# Altium project MPPT_PCB_Project.PrjPcb
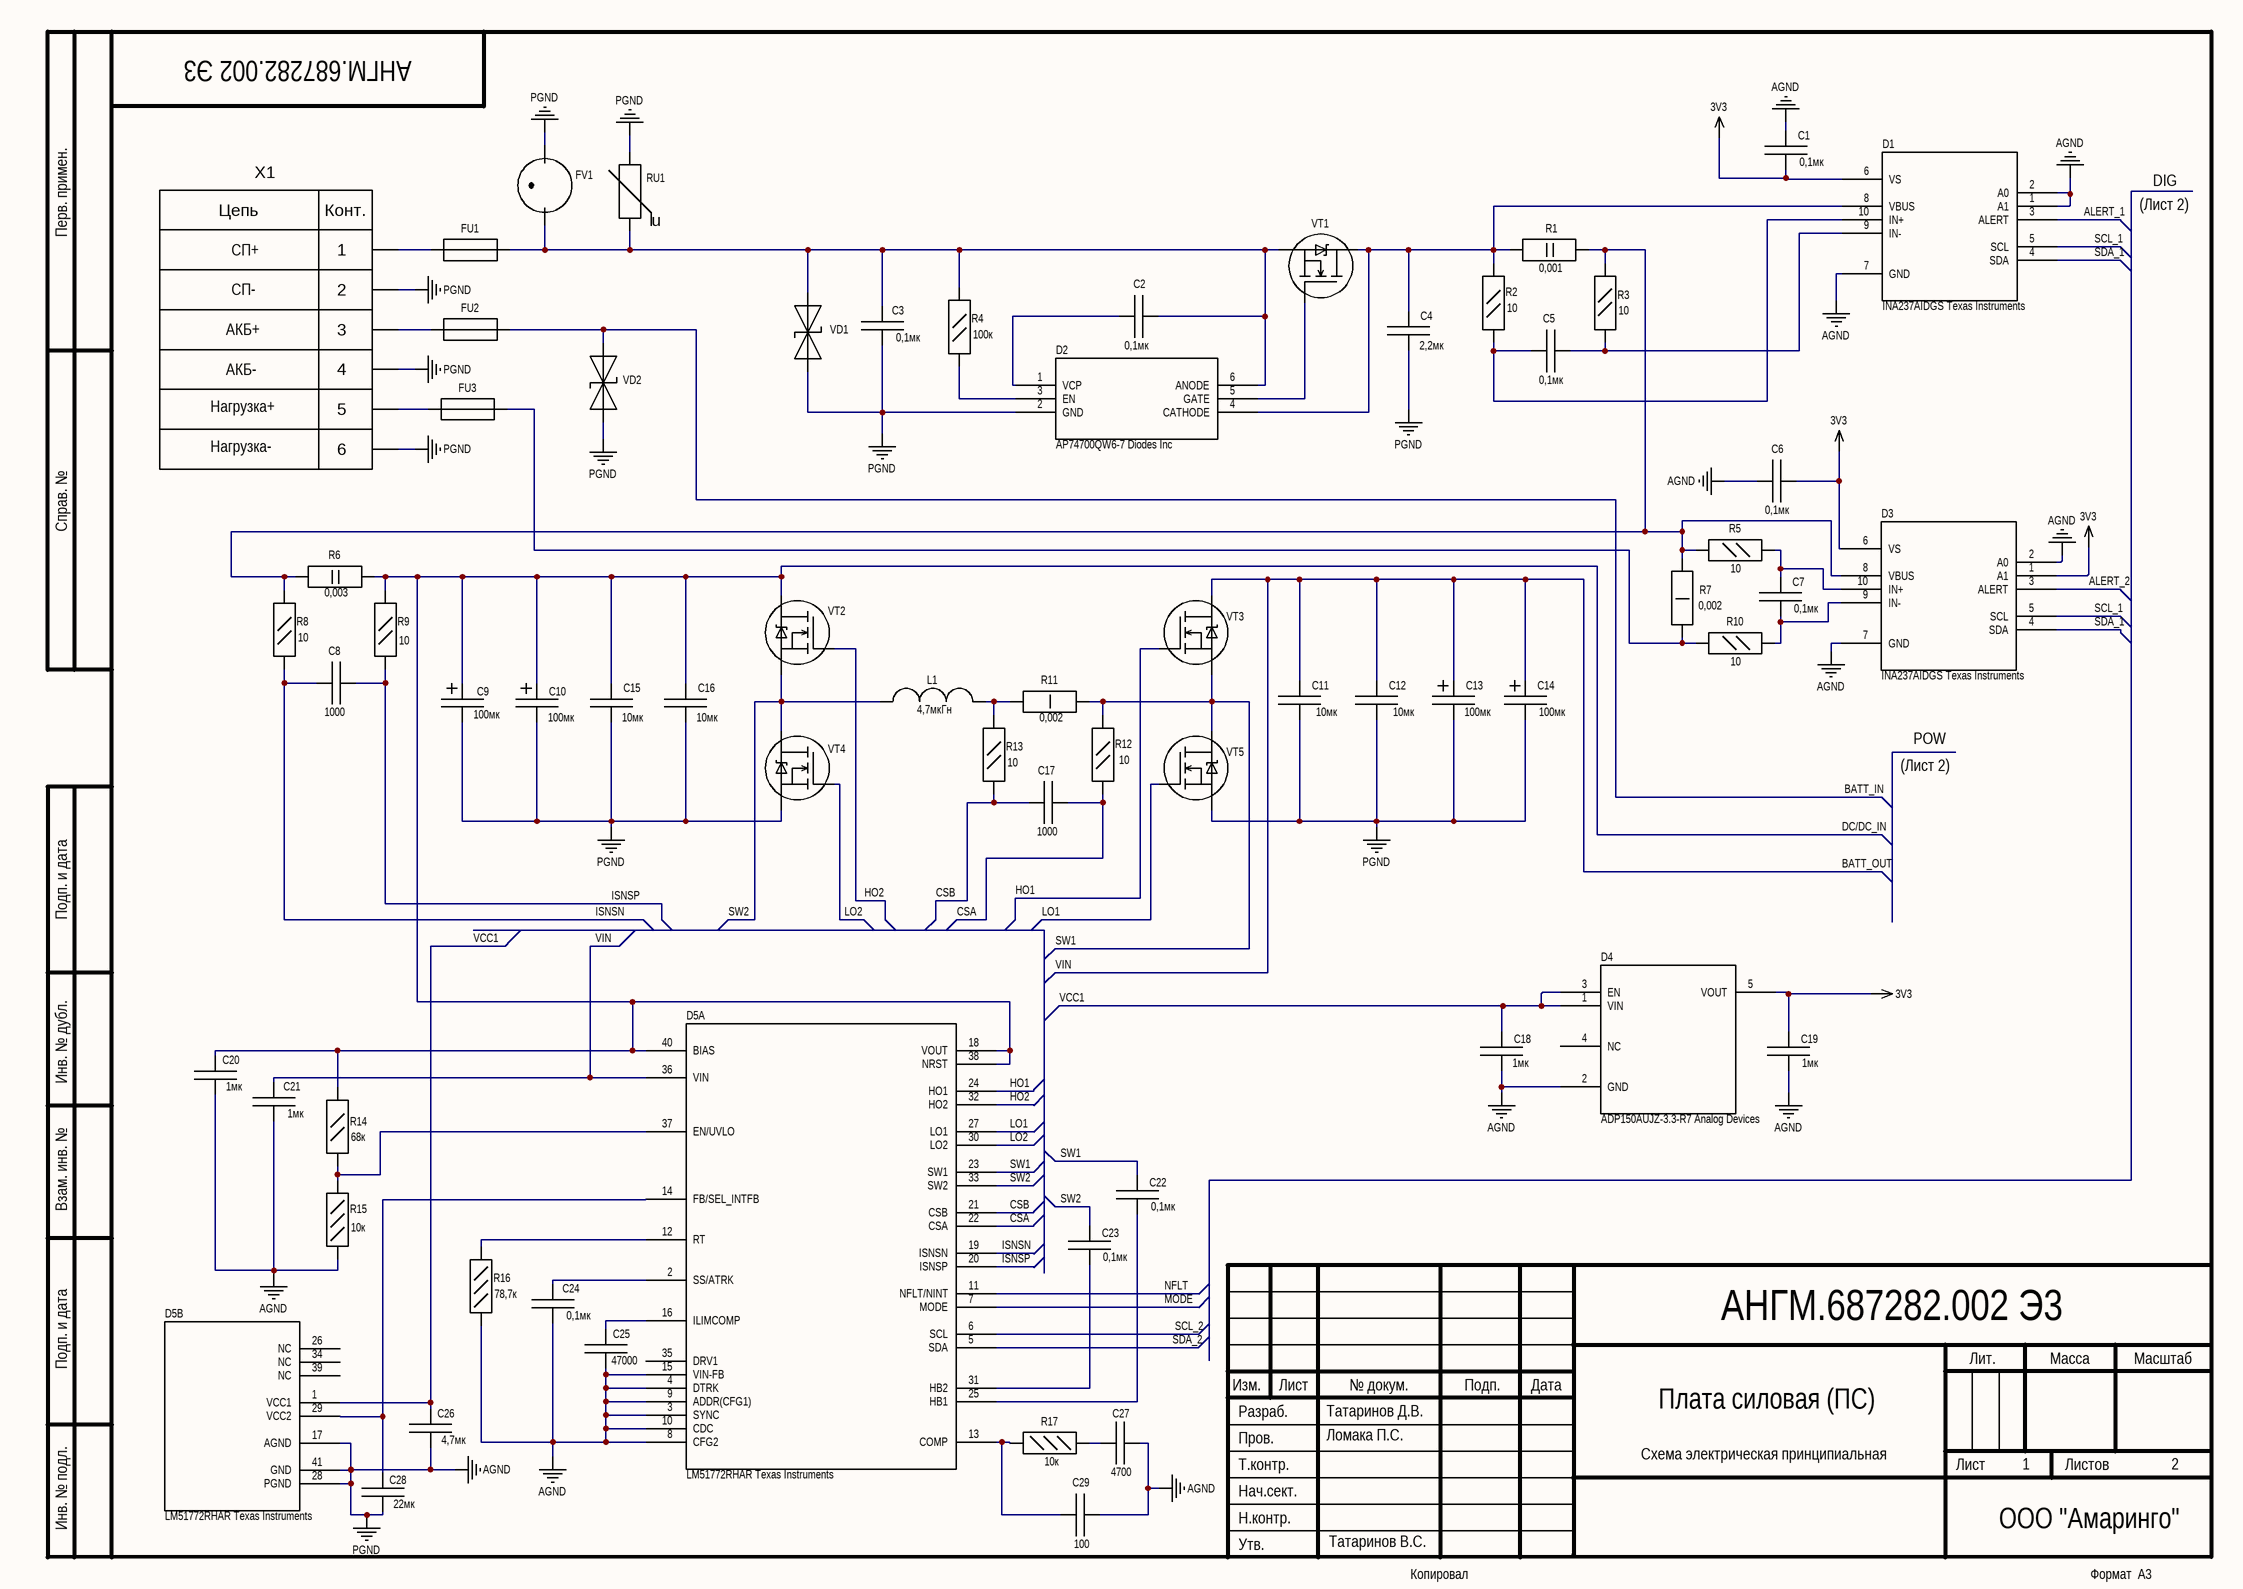
[diagram p0: Лист 1.SchDoc]
DecimalNumber: АНГМ.436437.002; Децимальный номер печатного узла: АНГМ.436437.002; Код типа схемы: Э3; Компания: ООО "Амаринго"; Литера: О1; Наименование: Печатная плата ПС; Наименование1: Печатная плата ПС; Наименование_PCB: Плата печатная ПС; Обозначение: АНГМ.758725.002 СБ; Обозначение_PCB: АНГМ.758725.002 СБ; Обозначение_Код: АНГМ.758725.002 СБ; Папка для сохранения графической документации: Документация; Папка для сохранения текстовой документации: Документация; Проверил: Ломака П.С.; Разработал: Татаринов Д.В.; Тип документа: Схема электрическая принципиальная; Утвердил: Татаринов В.С.; п_Пров_Р: Ломака; п_Разраб_Р: Татаринов; п_Утв_Р: Татаринов
2 sheets, 111 parts. Net scope: global (net labels, ports and power ports of the same name join across sheets).
Board file: MPPT_Power_Board.PcbDoc
Sheets:
  Лист 1.SchDoc
  Лист 2.SchDoc

## Sheet Лист 1.SchDoc
size 420 x 297 mm; ListNumber: 1; ApprovedBy: Татаринов В.С.; CheckedBy: Ломака П.С.; Author: Татаринов Д.В.; CompanyName: ООО "Амаринго"; SheetNumber: 1; SheetTotal: 2; PageSetup: Record=PageOptions|CenterHorizontal=True|CenterVertical=True|PrintScale=0.94|XCorrection=1.00|YCorrection=1.00|PrintKind=1|BorderSize=5000000|LeftOffset=0|BottomOffset=0|Orientation=1|PaperLength=1000|PaperWidth=1000|Scale=100|PaperSource=7|PrintQuality=-4|MediaType=1|DitherType=10|PaperKind=A4|PrintScaleMode=1; DecimalNumber: АНГМ.687282.002 Э3; Name: Силовая плата контроллера заряда MPPT; DocumentName: Sheet1.SCHDOC

### Parts
C1  Capacitance: 0,1мк  [CC0603]  (hidden comment: CL10B104KO8NNNC Samsung Electronics)
C2  Capacitance: 0,1мк  [CC0805]  (hidden comment: CC0805KKX7R0BB104 Yageo)
C3  Capacitance: 0,1мк  [CC0805]  (hidden comment: CC0805KKX7R0BB104 Yageo)
C4  Capacitance: 2,2мк  [CC1206]  (hidden comment: CC1206KKX7R0BB225 Yageo)
C5  Capacitance: 0,1мк  [CC0805]  (hidden comment: CC0805KKX7R0BB104 Yageo)
C6  Capacitance: 0,1мк  [CC0603]  (hidden comment: CL10B104KO8NNNC Samsung Electronics)
C7  Capacitance: 0,1мк  [CC0805]  (hidden comment: CC0805KKX7R0BB104 Yageo)
C8  Capacitance: 1000  [CC0603]  (hidden comment: GRM1885C1H102JA01D Murata Electronics)
C9  Capacitance: 100мк  [EEUFC2A101]  (hidden comment: 100ZLH100MEFC10x20 Rubycon)
C10  Capacitance: 100мк  [EEUFC2A101]  (hidden comment: 100ZLH100MEFC10x20 Rubycon)
C11  Capacitance: 10мк  [CC2220]  (hidden comment: 2220B106K101N05 Hitano)
C12  Capacitance: 10мк  [CC2220]  (hidden comment: 2220B106K101N05 Hitano)
C13  Capacitance: 100мк  [EEUFC2A101]  (hidden comment: 100ZLH100MEFC10x20 Rubycon)
C14  Capacitance: 100мк  [EEUFC2A101]  (hidden comment: 100ZLH100MEFC10x20 Rubycon)
C15  Capacitance: 10мк  [CC2220]  (hidden comment: 2220B106K101N05 Hitano)
C16  Capacitance: 10мк  [CC2220]  (hidden comment: 2220B106K101N05 Hitano)
C17  Capacitance: 1000  [CC0603]  (hidden comment: GRM1885C1H102JA01D Murata Electronics)
C18  Capacitence: 1мк  [CC0603]  (hidden comment: GCM188R71E105KA64D Murata Electronics)
C19  Capacitence: 1мк  [CC0603]  (hidden comment: GCM188R71E105KA64D Murata Electronics)
C20  Capacitance: 1мк  [CC0603]  (hidden comment: CC0603KRX7R9BB105 Yageo)
C21  Capacitance: 1мк  [CC0603]  (hidden comment: CC0603KRX7R9BB105 Yageo)
C22  Capacitance: 0,1мк  [CC0805]  (hidden comment: CC0805KKX7R0BB104 Yageo)
C23  Capacitance: 0,1мк  [CC0805]  (hidden comment: CC0805KKX7R0BB104 Yageo)
C24  Capacitance: 0,1мк  [CC0603]  (hidden comment: CL10B104KO8NNNC Samsung Electronics)
C25  Capacitance: 47000  [CC0603]  (hidden comment: CL10B473KB8NNNC Samsung Electronics)
C26  Capacitance: 4,7мк  [CC0805]  (hidden comment: CC0805KKX7R7BB475 Yageo)
C27  Capacitance: 4700  [CC0603]  (hidden comment: CC0603JRX7R9BB472 Yageo)
C28  Capacitance: 22мк  [CC1206]  (hidden comment: GRM31CR61C226KE15L Murata Electronics)
C29  Capacitance: 100  [CC0603]  (hidden comment: CC0603JRNPO9BN101 Yageo)
D1  INA237AIDGS Texas Instruments  [VSSOP]
D2  AP74700QW6-7 Diodes Inc  [SOT26]
D3  INA237AIDGS Texas Instruments  [VSSOP]
D4  ADP150AUJZ-3.3-R7 Analog Devices  [TSOT (UJ-5)]
D5  LM51772RHAR Texas Instruments  [LM51772]  (parts A,B of 2)
FU1  FT40A.50 Tesla  [3522-2_KEY]  (value not drawn)
FU2  0287020L Littelfuse  [3522-2_KEY]  (value not drawn)
FU3  0287020L Littelfuse  [3522-2_KEY]  (value not drawn)
FV1  B88069X1380S102 EPCOS  [B88069X1380S102 EPCOS]  (value not drawn)
L1  Inductance: 4,7мкГн  [SRP1770TA]  (hidden comment: SRP1770TA-4R7M Bourns)
R1  Resistance: 0,001  [RC2512]  (hidden comment: PMR100HZPFV1L00 Pohm)
R2  Resistance: 10  [RC0805]  (hidden comment: RC0805JR-0710RL Yageo)
R3  Resistance: 10  [RC0805]  (hidden comment: RC0805JR-0710RL Yageo)
R4  Resistance: 100к  [RC0805]  (hidden comment: RC0805JR-07100KL Yageo)
R5  Resistance: 10  [RC0805]  (hidden comment: RC0805JR-0710RL Yageo)
R6  Resistance: 0,003  [RC2512]  (hidden comment: FMF25FPJR003-BH Prosperity Dielectrics)
R7  Resistance: 0,002  [RC2512]  (hidden comment: RLM25FECR002 TA-I)
R8  Resistance: 10  [RC0805]  (hidden comment: RC0805JR-0710RL Yageo)
R9  Resistance: 10  [RC0805]  (hidden comment: RC0805JR-0710RL Yageo)
R10  Resistance: 10  [RC0805]  (hidden comment: RC0805JR-0710RL Yageo)
R11  Resistance: 0,002  [RC2512]  (hidden comment: RLM25FECR002 TA-I)
R12  Resistance: 10  [RC0805]  (hidden comment: RC0805JR-0710RL Yageo)
R13  Resistance: 10  [RC0805]  (hidden comment: RC0805JR-0710RL Yageo)
R14  Resistance: 68к  [RC0805]  (hidden comment: RC0805FR-0768KL Yageo)
R15  Resistance: 10к  [RC0603]  (hidden comment: RT0603BRD0710KL Yageo)
R16  Resistance: 78,7к  [RC0603]  (hidden comment: RC0603FR-0778K7L Yageo)
R17  Resistance: 10к  [RC0603]  (hidden comment: RT0603BRD0710KL Yageo)
RU1  Варистор 14D680K Yageo  [14D680K]  (value not drawn)
VD1  SMCJ51CA Littelfuse  [DO-214AB]  (value not drawn)
VD2  SMCJ30CA Hottech  [DO-214AB]  (value not drawn)
VT1  IRFS7730TRL7PP Infineon Technologies  [D2PAK-7PIN]  (value not drawn)
VT2  NTMFS5C628NLT1G ON Semiconductor  [DFN5 (SO-8FL)]  (value not drawn)
VT3  NTMFS5C628NLT1G ON Semiconductor  [DFN5 (SO-8FL)]  (value not drawn)
VT4  NTMFS5C628NLT1G ON Semiconductor  [DFN5 (SO-8FL)]  (value not drawn)
VT5  NTMFS5C628NLT1G ON Semiconductor  [DFN5 (SO-8FL)]  (value not drawn)
X1  DG78H-A-06P-13-00A(H) Degson Electronics  [DG78H-A-06P-13-00A(H)]  (value not drawn)

### Nets
3V3: C1.2 C6.2 C19.2 D1.6(VS) D3.1(A1) D3.6(VS) D4.5(VOUT)
AGND: C1.1 C3.1 C4.2 C6.1 C9.1 C10.1 C11.1 C12.1 C13.1 C14.1 C15.2 C16.2 C18.1 C19.1 C20.1 C21.1 C24.2 C25.2 C26.2 C27.2 C28.1 C29.2 D1.1(A1) D1.2(A0) D1.7(GND) D2.2(GND) D3.2(A0) D3.7(GND) D4.2(GND) D5.3(SYNC) D5.4(DTRK) D5.8(CFG2) D5.9(ADDR(CFG1)) D5.10(CDC) D5.15(VIN-FB) D5.17(AGND) D5.28(PGND) D5.41(GND) FV1.2 R15.2 R16.2 RU1.2 VD1.1 VD2.2 VT4.3(s) VT5.3(s) X1.2 X1.4 X1.6  [also labelled PGND]
ALERT_1: D1.3(ALERT)
ALERT_2: D3.3(ALERT)
BATT_IN: FU2.2 VD2.1
BATT_OUT: C11.2 C12.2 C13.2 C14.2 C21.2 D5.36(VIN) VT3.2(d)  [also labelled VIN]
CSA: C17.2 D5.22(CSA) R12.2
CSB: C17.1 D5.21(CSB) R13.2
DC/DC_IN: C9.2 C10.2 C15.1 C16.1 C20.2 D5.18(VOUT) D5.38(NRST) D5.40(BIAS) R6.2 R9.1 R14.1 VT2.2(d)
HO1: D5.24(HO1) VT3.1(g)
HO2: D5.32(HO2) VT2.1(g)
ISNSN: C8.1 D5.19(ISNSN) R8.2
ISNSP: C8.2 D5.20(ISNSP) R9.2
LO1: D5.27(LO1) VT5.1(g)
LO2: D5.30(LO2) VT4.1(g)
MODE: D5.7(MODE)
NFLT: D5.11(NFLT/NINT)
SCL_1: D1.5(SCL) D3.5(SCL)
SCL_2: D5.6(SCL)
SDA_1: D1.4(SDA) D3.4(SDA)
SDA_2: D5.5(SDA)
SW1: C22.2 D5.23(SW1) R11.2 R12.1 VT3.3(s) VT5.2(d)
SW2: C23.2 D5.33(SW2) L1.1 VT2.3(s) VT4.2(d)
VCC1: C18.2 C26.1 D4.1(VIN) D4.3(EN) D5.1(VCC1)
NetC2_1: C2.1 D2.1(VCP)
NetC2_2: C2.2 C3.2 D2.6(ANODE) FU1.2 FV1.1 R4.1 RU1.1 VD1.2 VT1.3(s)
NetC4_1: C4.1 D1.8(VBUS) D2.4(CATHODE) R1.1 R2.1 VT1.2(d)
NetC5_1: C5.1 D1.10(IN+) R2.2
NetC5_2: C5.2 D1.9(IN-) R3.1
NetC7_1: C7.1 D3.10(IN+) R5.2
NetC7_2: C7.2 D3.9(IN-) R10.2
NetC22_1: C22.1 D5.25(HB1)
NetC23_1: C23.1 D5.31(HB2)
NetC24_1: C24.1 D5.2(SS/ATRK)
NetC25_1: C25.1 D5.16(ILIMCOMP)
NetC27_1: C27.1 R17.2
NetC28_2: C28.2 D5.14(FB/SEL_INTFB) D5.29(VCC2)
NetC29_1: C29.1 D5.13(COMP) R17.1
NetD2_3: D2.3(EN) R4.2
NetD2_5: D2.5(GATE) VT1.1(g)
NetD3_8: D3.8(VBUS) R1.2 R3.2 R5.1 R6.1 R7.1 R8.1
NetD5_12: D5.12(RT) R16.1
NetD5_37: D5.37(EN/UVLO) R14.2 R15.1
NetFU1_1: FU1.1 X1.1
NetFU2_1: FU2.1 X1.3
NetFU3_1: FU3.1 X1.5
NetFU3_2: FU3.2 R7.2 R10.1
NetL1_2: L1.2 R11.1 R13.1

Not connected (* = marked no-connect by the designer): D4 4(NC); D5 26(NC) 34(NC) 35(DRV1) 39(NC)

### Notes on the sheet
- DIG
- СП+
- (Лист 2)
- СП-
- АКБ+
- АКБ-
- Нагрузка+
- Нагрузка-
- POW
- 2
- Перв. примен.
- Справ. №
- Подп. и дата
- Инв. № дубл.
- Взам. инв. №
- Разраб.
- Изм.
- Лист
- № докум.
- Подп.
- Дата
- Лит.
- Масса
- Масштаб
- Т.контр.
- Пров.
- Плата силовая (ПС)
- Схема электрическая принципиальная
- Листов
- Инв. № подл.
- Утв.
- Н.контр.
- Нач.сект.
- Копировал
- Формат  A3
- (in symbol R_U) u
- (in symbol X_6) Цепь; Конт.

### Library data of the parts
C1 C4 C6-C8 C11 C12 C15 C16 C24 C27 = C: ComponentKind: Конденсатор
  C1 C6 C24: Наименование: CL10B104KO8NNNC Samsung Electronics; Manufacturer: Samsung Electronics; PartNumber: CL10B104KO8NNNC
  C4: Наименование: CC1206KKX7R0BB225 Yageo; Manufacturer: Yageo; PartNumber: CC1206KKX7R0BB225
  C7: Наименование: CC0805KKX7R0BB104 Yageo; Manufacturer: Yageo; PartNumber: CC0805KKX7R0BB104
  C8: Наименование: GRM1885C1H102JA01D Murata Electronics; Manufacturer: Murata Electronics; PartNumber: GRM1885C1H102JA01D
  C11 C12 C15 C16: Наименование: 2220B106K101N05 Hitano; Manufacturer: Hitano; PartNumber: 2220B106K101N05
  C27: Наименование: CC0603JRX7R9BB472 Yageo; Manufacturer: Yageo; PartNumber: CC0603JRX7R9BB472
C2 = C: Керамический, 50В, X7R; ComponentKind: Конденсатор; Наименование: CC0805KKX7R0BB104 Yageo; Manufacturer: Yageo; PartNumber: CC0805KKX7R0BB104
C3 = C: Керамический, 100В, X7R; ComponentKind: Конденсатор; Наименование: CC0805KKX7R0BB104 Yageo; Manufacturer: Yageo; PartNumber: CC0805KKX7R0BB104
C5 C17 = C: Керамический; ComponentKind: Конденсатор
  C5: Наименование: CC0805KKX7R0BB104 Yageo; Manufacturer: Yageo; PartNumber: CC0805KKX7R0BB104
  C17: Наименование: GRM1885C1H102JA01D Murata Electronics; Manufacturer: Murata Electronics; PartNumber: GRM1885C1H102JA01D
C9 C10 C13 C14 = C_POL: ComponentKind: Конденсатор; Наименование: 100ZLH100MEFC10x20 Rubycon; Manufacturer: Rubycon; PartNumber: 100ZLH100MEFC10x20
C18 = C: Керами; ComponentKind: Конденсатор; Наименование: GCM188R71E105KA64D Murata Electronics; Manufacturer: Murata Electronics; PartNumber: GCM188R71E105KA64D
C19 = C: Керамический, от 10В; ComponentKind: Конденсатор; Наименование: GCM188R71E105KA64D Murata Electronics; Manufacturer: Murata Electronics; PartNumber: GCM188R71E105KA64D
C20 C21 = C: Керамический, 50В; ComponentKind: Конденсатор; Наименование: CC0603KRX7R9BB105 Yageo; Manufacturer: Yageo; PartNumber: CC0603KRX7R9BB105
C22 C23 = C: Керамика, 50В; ComponentKind: Конденсатор; Наименование: CC0805KKX7R0BB104 Yageo; Manufacturer: Yageo; PartNumber: CC0805KKX7R0BB104
C25 = C: Керамический, X7R или NP0/COG; ComponentKind: Конденсатор; Наименование: CL10B473KB8NNNC Samsung Electronics; Manufacturer: Samsung Electronics; PartNumber: CL10B473KB8NNNC
C26 = C: Керамический, X7R, 10-16В; ComponentKind: Конденсатор; Наименование: CC0805KKX7R7BB475 Yageo; Manufacturer: Yageo; PartNumber: CC0805KKX7R7BB475
C28 = C: Керамический, X7R (X5R), 10-16В; ComponentKind: Конденсатор; Наименование: GRM31CR61C226KE15L Murata Electronics; Manufacturer: Murata Electronics; PartNumber: GRM31CR61C226KE15L
C29 = C: Керамический, NP0 (COG); ComponentKind: Конденсатор; Наименование: CC0603JRNPO9BN101 Yageo; Manufacturer: Yageo; PartNumber: CC0603JRNPO9BN101
D1 D3 = INA237AIDGSR: 85-V, 16-bit, I2C output current/voltage/power monitor with alert 10-VSSOP -40 to 125; Copyright: Copyright (C) 2026 Ultra Librarian. All rights reserved.; Manufacturer_Name: Texas Instruments; Manufacturer_Part_Number: INA237AIDGSR; RefDes: RefDes; Type: Type; ComponentKind: Микросхема; Наименование: INA237AIDGS Texas Instruments; Manufacturer: Texas Instruments; PartNumber: INA237AIDGS
D2 = AP74700QW6-7: Description; Copyright: Copyright (C) 2025 Ultra Librarian. All rights reserved.; Manufacturer_Name: Diodes Inc; Manufacturer_Part_Number: AP74700QW6-7; RefDes: RefDes; Type: Type; ComponentKind: Микросхема; Наименование: AP74700QW6-7 Diodes Inc; Manufacturer: Diodes Inc; PartNumber: AP74700QW6-7
D4 = ADP150AUJZ-3.3-R7: Ultralow Noise, 150 mA CMOS Linear Regulator; Manufacturer_Name: Analog Devices Inc; Copyright: Copyright (C) 2025 Ultra Librarian. All rights reserved.; Manufacturer_Part_Number: ADP150AUJZ-3.3-R7; RefDes: RefDes; Type: Type; ComponentKind: Микросхема; Наименование: ADP150AUJZ-3.3-R7 Analog Devices; Manufacturer: Analog Devices; PartNumber: ADP150AUJZ-3.3-R7
D5 = LM51772RHAR: 55V wide VIN four-switch buck-boost controller with I2C interface 40-VQFN -40 to 125; Copyright: Copyright (C) 2025 Ultra Librarian. All rights reserved.; Manufacturer_Name: Texas Instruments; Manufacturer_Part_Number: LM51772RHAR; RefDes: RefDes; Type: Type; ComponentKind: Микросхема; Наименование: LM51772RHAR Texas Instruments; Manufacturer: Texas Instruments; PartNumber: LM51772RHAR
FU1 = FU: 40А; ComponentKind: Предохранитель; Наименование: FT40A.50 Tesla; Manufacturer: Tesla; PartNumber: FT40A.50
FU2 FU3 = FU: 20А; ComponentKind: Предохранитель; Наименование: 0287020L Littelfuse; Manufacturer: Littelfuse; PartNumber: 0287020L
FV1 = FV: ComponentKind: Разрядник; Наименование: B88069X1380S102 EPCOS; Manufacturer: EPCOS; PartNumber: B88069X1380S102
L1 = L: ComponentKind: Дроссель; Наименование: SRP1770TA-4R7M Bourns; Manufacturer: Bourns; PartNumber: SRP1770TA-4R7M
R1 = R_2W: Корпус 2512 или 2816; Power: 2 Вт; Tolerance: 1%; Value: 1 мОм; ComponentKind: Резистор; Type: RC2512; Наименование: PMR100HZPFV1L00 Pohm; Manufacturer: Pohm; PartNumber: PMR100HZPFV1L00
R2 R3 R8 R9 R12 R13 = R_0,125W: Корпус 0603; Power: 0,125 Вт; Tolerance: 5%; Value: 10 Ом; ComponentKind: Резистор; Type: RC0805; Наименование: RC0805JR-0710RL Yageo; Manufacturer: Yageo; PartNumber: RC0805JR-0710RL
R4 = R_0,125W: Корпус 0603; Power: 0,125 Вт; Tolerance: 5%; Value: 100 кОм; ComponentKind: Резистор; Type: RC0805; Наименование: RC0805JR-07100KL Yageo; Manufacturer: Yageo; PartNumber: RC0805JR-07100KL
R5 R10 = R_0,125W: Power: 0,125 Вт; Tolerance: 5%; Value: 10 Ом; ComponentKind: Резистор; Type: RC0805; Наименование: RC0805JR-0710RL Yageo; Manufacturer: Yageo; PartNumber: RC0805JR-0710RL
R6 = R_2W: Корпус 2512; Power: 2 Вт; Tolerance: 1%; Value: 3 мОм; ComponentKind: Резистор; Type: RC2512; Наименование: FMF25FPJR003-BH Prosperity Dielectrics; Manufacturer: Prosperity Dielectrics; PartNumber: FMF25FPJR003-BH
R7 R11 = R_1W: Корпус 2512; Power: 1 Вт; Tolerance: 1%; Value: 2 мОм; ComponentKind: Резистор; Type: RC2512; Наименование: RLM25FECR002 TA-I; Manufacturer: TA-I; PartNumber: RLM25FECR002
R14 = R_0,125W: Корпус 0603; Power: 0,125 Вт; Tolerance: 1%; Value: 68 кОм; ComponentKind: Резистор; Type: RC0805; Наименование: RC0805FR-0768KL Yageo; Manufacturer: Yageo; PartNumber: RC0805FR-0768KL
R15 R17 = R_0,05W: Корпус 0402; Power: 0,05 Вт; Tolerance: 1%; Value: 10 кОм; ComponentKind: Резистор; Type: RC0201; Наименование: RT0603BRD0710KL Yageo; Manufacturer: Yageo; PartNumber: RT0603BRD0710KL
R16 = R_0,05W: Корпус 0402; Power: 0,05 Вт; Tolerance: 1%; Value: 78,7 кОм; ComponentKind: Резистор; Type: RC0201; Наименование: RC0603FR-0778K7L Yageo; Manufacturer: Yageo; PartNumber: RC0603FR-0778K7L
RU1 = R_U: ComponentKind: Варистор; Наименование: 14D680K Yageo; Manufacturer: Yageo; PartNumber: 14D680K
VD1 = VD_TVS: Наименование: Диод защитный SMCJ51CA Littelfuse; ComponentKind: Диод защитный; Manufacturer: Littelfuse; PartNumber: SMCJ51CA
VD2 = VD_TVS: SMCJ33A; Наименование: Диод защитный SMCJ30CA Hottech; ComponentKind: Диод защитный; Manufacturer: Hottech; PartNumber: SMCJ30CA
VT1 = N_GDS: ComponentKind: Транзистор; Наименование: IRFS7730TRL7PP Infineon Technologies; Manufacturer: Infineon Technologies; PartNumber: IRFS7730TRL7PP
VT2-VT5 = N_GDS: Наименование: Транзистор NTMFS5C628NLT1G ON Semiconductor; ComponentKind: Транзистор; Manufacturer: ON Semiconductor; PartNumber: NTMFS5C628NLT1G
X1 = X_6: ComponentKind: Клеммник; Наименование: DG78H-A-06P-13-00A(H) Degson Electronics; Manufacturer: Degson Electronics; PartNumber: DG78H-A-06P-13-00A(H)

## Sheet Лист 2.SchDoc: Наименование
size 420 x 297 mm; ListNumber: 1; SheetNumber: 2; SheetTotal: 2; PageSetup: Record=PageOptions|CenterHorizontal=True|CenterVertical=True|PrintScale=0.94|XCorrection=1.00|YCorrection=1.00|PrintKind=1|BorderSize=5000000|LeftOffset=0|BottomOffset=0|Orientation=1|PaperLength=1000|PaperWidth=1000|Scale=100|PaperSource=7|PrintQuality=-4|MediaType=1|DitherType=10|PaperKind=A4|PrintScaleMode=1; DecimalNumber: АНГМ.687282.002 Э3; Name: ООО "Амаринго"; DocumentName: Sheet1.SCHDOC
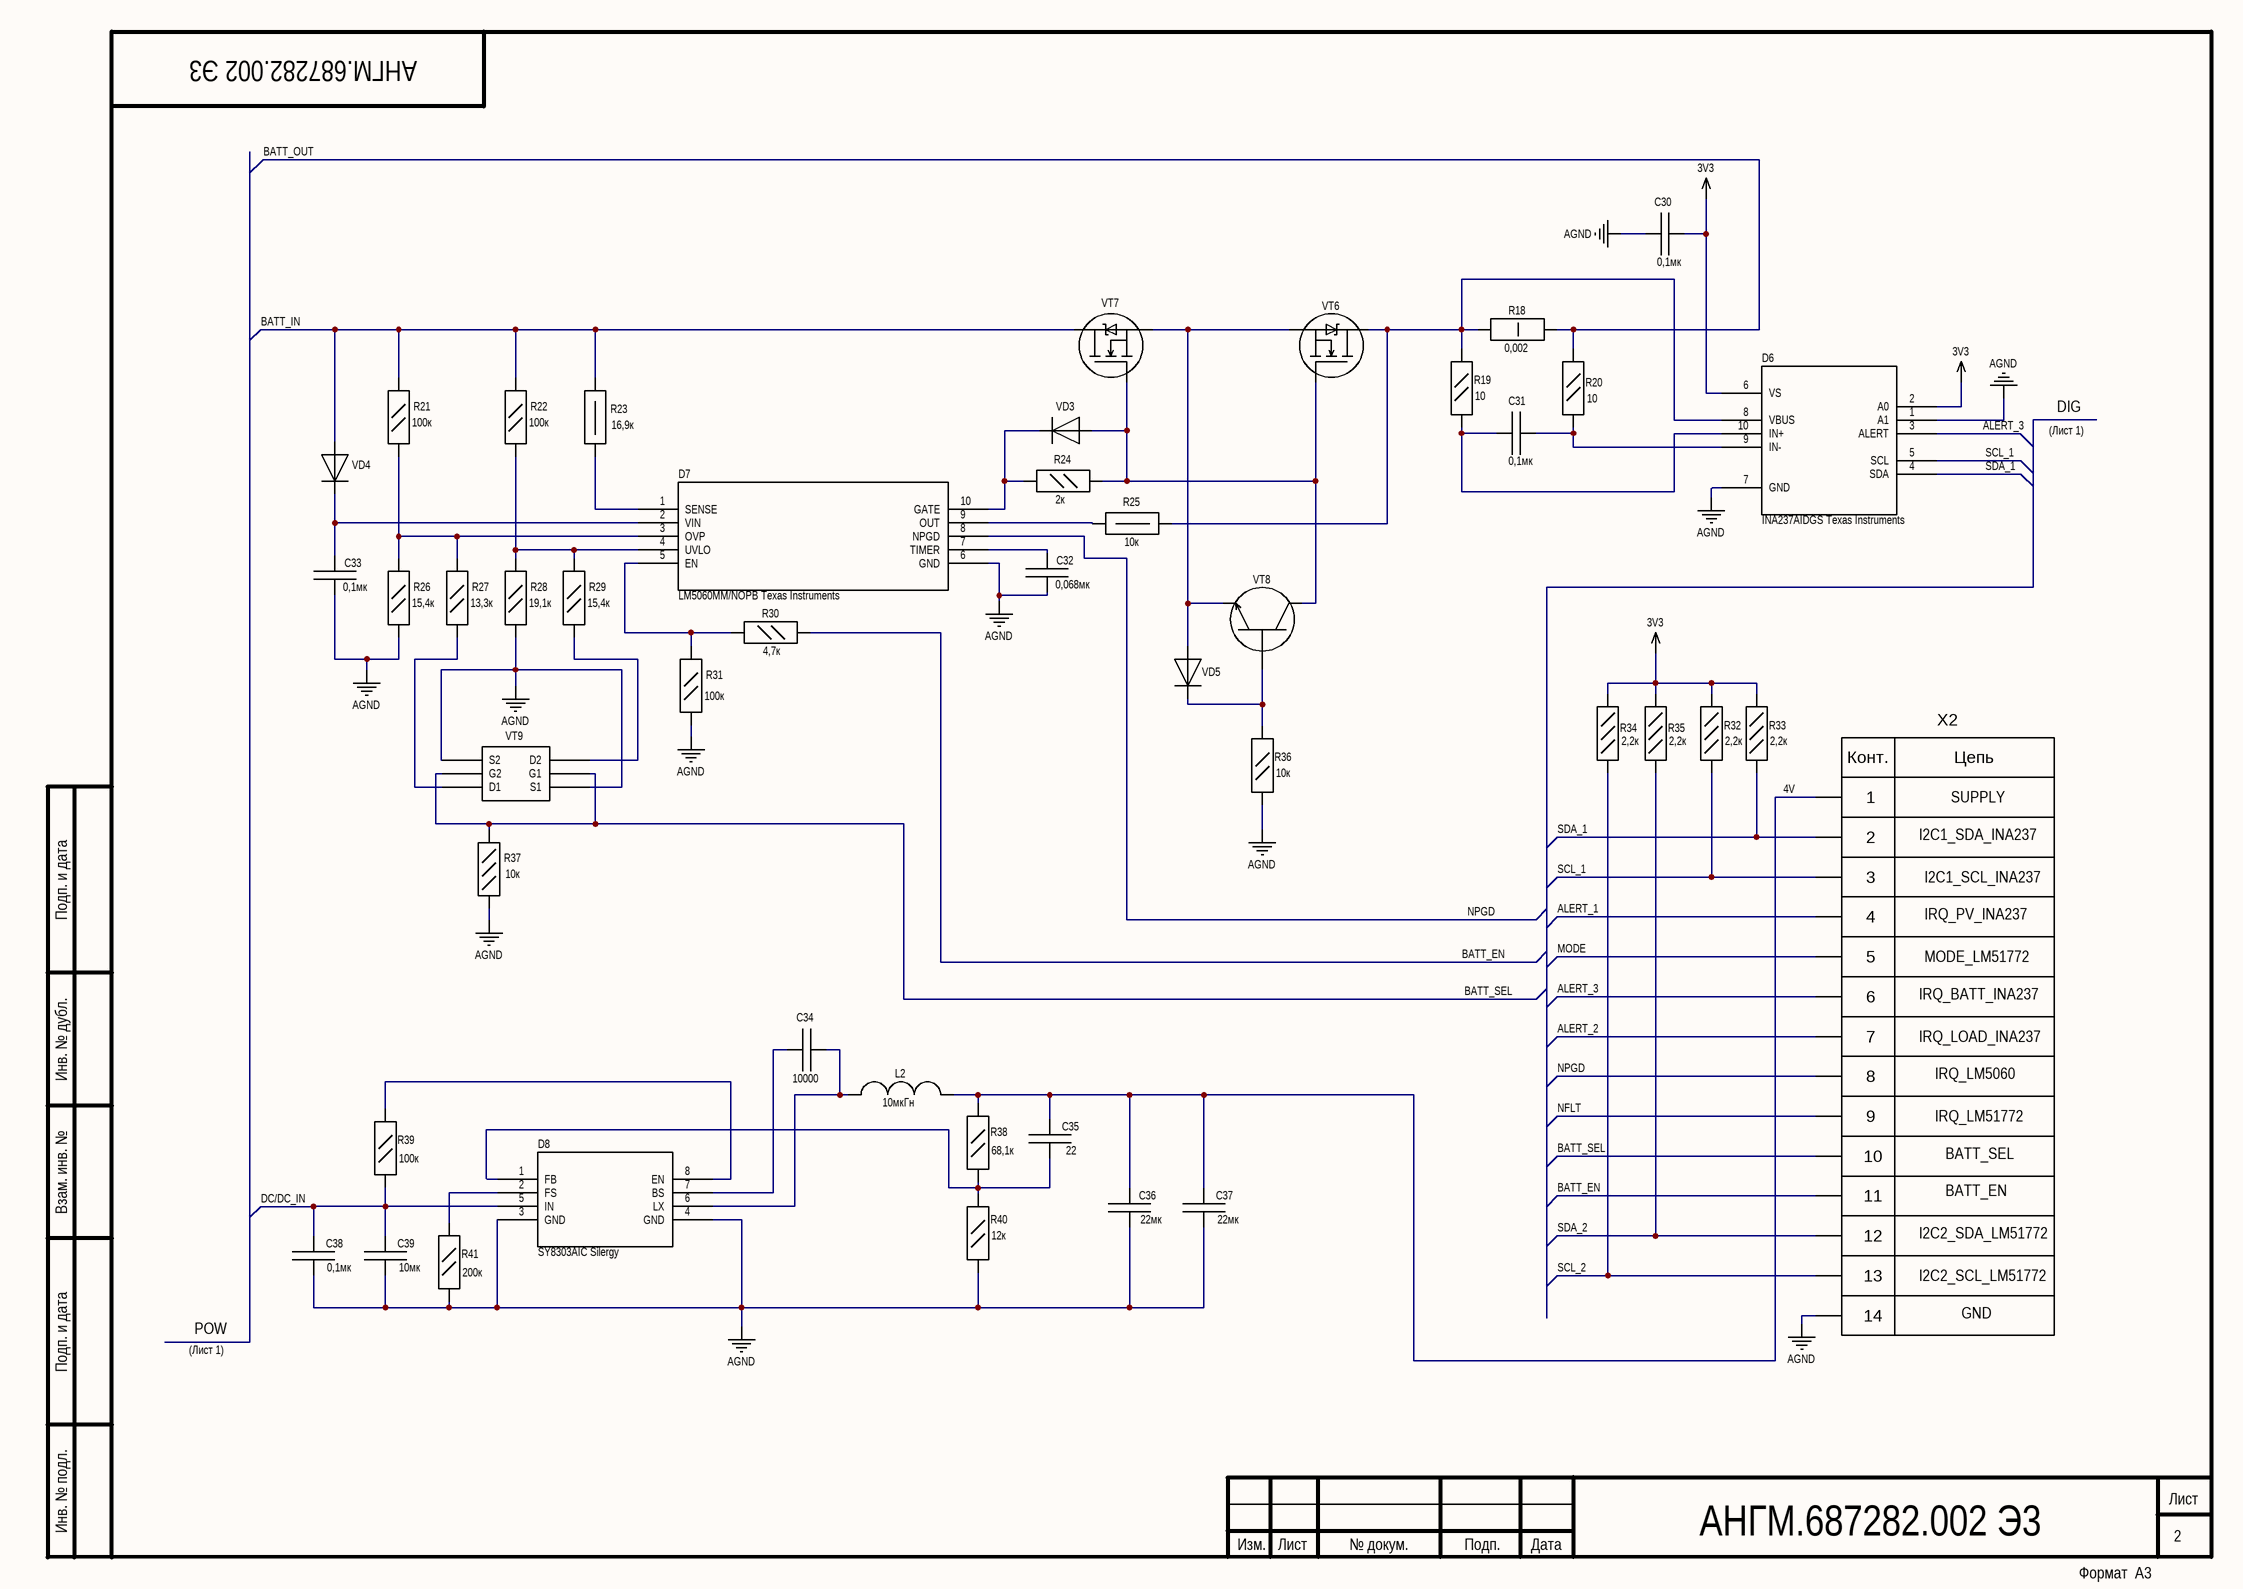
[diagram p1: Лист 2.SchDoc]

### Parts
C30  Capacitence: 0,1мк  [CC0603]  (hidden comment: CL10B104KO8NNNC Samsung Electronics)
C31  Capacitance: 0,1мк  [CC0805]  (hidden comment: CC0805KKX7R0BB104 Yageo)
C32  Capacitence: 0,068мк  [CC0603]  (hidden comment: GRM188R71C683K Murata Electronics)
C33  Capacitence: 0,1мк  [CC0805]  (hidden comment: CC0805KKX7R0BB104 Yageo)
C34  Capacitence: 10000  [CC0603]  (hidden comment: CC0603KRX7R9BB103 Yageo)
C35  Capacitence: 22  [CC0603]  (hidden comment: CC0603JRNPO9BN220 Yageo)
C36  Capacitence: 22мк  [CC1206]  (hidden comment: GRM31CR61C226KE15L Murata Electronics)
C37  Capacitence: 22мк  [CC1206]  (hidden comment: GRM31CR61C226KE15L Murata Electronics)
C38  Capacitence: 0,1мк  [CC0805]  (hidden comment: CC0805KKX7R0BB104 Yageo)
C39  Capacitence: 10мк  [CC1206]  (hidden comment: CL31B106KBHNNNE Samsung Electronics)
D6  INA237AIDGS Texas Instruments  [VSSOP]
D7  LM5060MM/NOPB Texas Instruments  [VSSOP]
D8  SY8303AIC Silergy  [TSOT23-8]
L2  Inductance: 10мкГн  [IHLP2525CZER100M01]  (hidden comment: IHLP2525CZER100M01 Vishay)
R18  Resistance: 0,002  [RC2512]  (hidden comment: RLM25FECR002 TA-I)
R19  Resistance: 10  [RC0805]  (hidden comment: RC0805JR-0710RL Yageo)
R20  Resistance: 10  [RC0805]  (hidden comment: RC0805JR-0710RL Yageo)
R21  Resistance: 100к  [RC0805]  (hidden comment: RC0805FR-07100KL Yageo)
R22  Resistance: 100к  [RC0805]  (hidden comment: RC0805FR-07100KL Yageo)
R23  Resistance: 16,9к  [RC1210]  (hidden comment: RC1210FR-0716K9L Yageo)
R24  Resistance: 2к  [RC0805]  (hidden comment: RC0805JR-072KL Yageo)
R25  Resistance: 10к  [RC1210]  (hidden comment: RC1210JR-0710KL Yageo)
R26  Resistance: 15,4к  [RC0805]  (hidden comment: RC0805FR-0715K4L Yageo)
R27  Resistance: 13,3к  [RC0805]  (hidden comment: RC0805FR-0713K3L Yageo)
R28  Resistance: 19,1к  [RC0805]  (hidden comment: RC0805FR-0719K1L Yageo)
R29  Resistance: 15,4к  [RC0805]  (hidden comment: RC0805FR-0715K4L Yageo)
R30  Resistance: 4,7к  [RC0805]  (hidden comment: RC0805JR-074K7L Yageo)
R31  Resistance: 100к  [RC0805]  (hidden comment: RC0805JR-07100KL Yageo)
R32  Resistance: 2,2к  [RC0603]  (hidden comment: RC0603FR-072K2L Yageo)
R33  Resistance: 2,2к  [RC0603]  (hidden comment: RC0603FR-072K2L Yageo)
R34  Resistance: 2,2к  [RC0603]  (hidden comment: RC0603FR-072K2L Yageo)
R35  Resistance: 2,2к  [RC0603]  (hidden comment: RC0603FR-072K2L Yageo)
R36  Resistance: 10к  [RC0805]  (hidden comment: RC0805JR-0710KL Yageo)
R37  Resistance: 10к  [RC0603]  (hidden comment: RT0603BRD0710KL Yageo)
R38  Resistance: 68,1к  [RC0805]  (hidden comment: RC0805FR-0768K1L Yageo)
R39  Resistance: 100к  [RC0805]  (hidden comment: RC0805JR-07100KL Yageo)
R40  Resistance: 12к  [RC0805]  (hidden comment: RC0805FR-0712KL Yageo)
R41  Resistance: 200к  [RC0805]  (hidden comment: RC0805FR-07200KL Yageo)
VD3  Диод 1N4148W Diotec Semiconductor  [SOD-123F]  (value not drawn)
VD4  Диод 1N4148W Diotec Semiconductor  [SOD-123F]  (value not drawn)
VD5  Диод 1N4148W Diotec Semiconductor  [SOD-123F]  (value not drawn)
VT6  NTMFS5C628NLT1G ON Semiconductor  [DFN5 (SO-8FL)]  (value not drawn)
VT7  NTMFS5C628NLT1G ON Semiconductor  [DFN5 (SO-8FL)]  (value not drawn)
VT8  MMBT5551LT1G ON Semiconductor  [SOT-23-3]  (value not drawn)
VT9  BSS138DW-7-F Diodes Inc  [SOT363]  (value not drawn)
X2  DS1023-2x7 Connfly electronic  [PBD-2x7]  (value not drawn)

### Nets
3V3: C30.1 D6.2(A0) D6.6(VS) R32.2 R33.2 R34.2 R35.2
AGND: C30.2 C32.2 C33.1 C36.2 C37.2 C38.2 C39.2 D6.1(A1) D6.7(GND) D7.6(GND) D8.3(GND) D8.4(GND) R26.2 R28.2 R31.2 R36.2 R37.2 R40.2 R41.1 VT9.1(S1) VT9.4(S2) X2.14
4V: C35.1 C36.1 C37.1 L2.2 R38.1 X2.1
ALERT_1: X2.4
ALERT_2: X2.7
ALERT_3: D6.3(ALERT) X2.6
BATT_EN: R30.2 X2.11
BATT_IN: R21.1 R22.1 R23.1 VD4.1(A) VT7.2(d)
BATT_OUT: R18.2 R20.2
BATT_SEL: R37.1 VT9.2(G1) VT9.5(G2) X2.10
DC/DC_IN: C38.1 C39.1 D8.5(IN) R39.2
MODE: X2.5
NFLT: X2.9
NPGD: D7.8(NPGD) X2.8
SCL_1: D6.5(SCL) R32.1 X2.3
SCL_2: R34.1 X2.13
SDA_1: D6.4(SDA) R33.1 X2.2
SDA_2: R35.1 X2.12
NetC31_1: C31.1 D6.9(IN-) R20.1
NetC31_2: C31.2 D6.10(IN+) R19.1
NetC32_1: C32.1 D7.7(TIMER)
NetC33_2: C33.2 D7.2(VIN) VD4.2(C)
NetC34_1: C34.1 D8.7(BS)
NetC34_2: C34.2 D8.6(LX) L2.1
NetC35_2: C35.2 D8.1(FB) R38.2 R40.1
NetD6_8: D6.8(VBUS) R18.1 R19.2 R25.2 VT6.2(d)
NetD7_1: D7.1(SENSE) R23.2
NetD7_3: D7.3(OVP) R21.2 R26.1 R27.1
NetD7_4: D7.4(UVLO) R22.2 R28.1 R29.1
NetD7_5: D7.5(EN) R30.1 R31.1
NetD7_9: D7.9(OUT) R25.1
NetD7_10: D7.10(GATE) R24.1 VD3.2(C)
NetD8_2: D8.2(FS) R41.2
NetD8_8: D8.8(EN) R39.1
NetR24_2: R24.2 VD3.1(A) VT6.1(g) VT7.1(g) VT8.3(c)
NetR27_2: R27.2 VT9.6(D1)
NetR29_2: R29.2 VT9.3(D2)
NetR36_1: R36.1 VD5.2(C) VT8.1(b)
NetVD5_1: VD5.1(A) VT6.3(s) VT7.3(s) VT8.2(e)

### Notes on the sheet
- (Лист 1)
- DIG
- I2C1_SDA_INA237
- SUPPLY
- I2C1_SCL_INA237
- IRQ_PV_INA237
- IRQ_BATT_INA237
- MODE_LM51772
- IRQ_LOAD_INA237
- IRQ_LM5060
- IRQ_LM51772
- BATT_SEL
- BATT_EN
- I2C2_SDA_LM51772
- POW
- I2C2_SCL_LM51772
- GND
- АНГМ.687282.002 Э3
- Подп. и дата
- Инв. № дубл.
- Взам. инв. №
- Инв. № подл.
- Изм.
- Лист
- № докум.
- Подп.
- Дата
- Формат  A3
- (in symbol X_14) Конт.; Цепь

### Library data of the parts
C30-C33 = C: ComponentKind: Конденсатор
  C30: Наименование: CL10B104KO8NNNC Samsung Electronics; Manufacturer: Samsung Electronics; PartNumber: CL10B104KO8NNNC
  C31 C33: Наименование: CC0805KKX7R0BB104 Yageo; Manufacturer: Yageo; PartNumber: CC0805KKX7R0BB104
  C32: Наименование: GRM188R71C683K Murata Electronics; Manufacturer: Murata Electronics; PartNumber: GRM188R71C683K
C34 C38 = C: Керамический, 50В, 0603; ComponentKind: Конденсатор; Manufacturer: Yageo
  C34: Наименование: CC0603KRX7R9BB103 Yageo; PartNumber: CC0603KRX7R9BB103
  C38: Наименование: CC0805KKX7R0BB104 Yageo; PartNumber: CC0805KKX7R0BB104
C35 = C: Керамический, 16В, NPO (COG), от 16В, 0603,0402.; ComponentKind: Конденсатор; Наименование: CC0603JRNPO9BN220 Yageo; Manufacturer: Yageo; PartNumber: CC0603JRNPO9BN220
C36 C37 = C: Керамический, 16В, 0805; ComponentKind: Конденсатор; Наименование: GRM31CR61C226KE15L Murata Electronics; Manufacturer: Murata Electronics; PartNumber: GRM31CR61C226KE15L
C39 = C: Керамический, 50В, X7R, корпус 1206; ComponentKind: Конденсатор; Наименование: CL31B106KBHNNNE Samsung Electronics; Manufacturer: Samsung Electronics; PartNumber: CL31B106KBHNNNE
D6 = INA237AIDGSR: as D1 on sheet Лист 1; Copyright: Copyright (C) 2026 Ultra Librarian. All rights reserved.; Manufacturer_Name: Texas Instruments; Manufacturer_Part_Number: INA237AIDGSR; RefDes: RefDes; Type: Type; ComponentKind: Микросхема; Наименование: INA237AIDGS Texas Instruments; Manufacturer: Texas Instruments; PartNumber: INA237AIDGS
D7 = LM5060MMNOPB: 5.5-V to 65-V high side protection controller 10-VSSOP -40 to 125; Copyright: Copyright (C) 2025 Ultra Librarian. All rights reserved.; Manufacturer_Name: Texas Instruments; Manufacturer_Part_Number: LM5060MM/NOPB; RefDes: RefDes; Type: Type; ComponentKind: Микросхема; Наименование: LM5060MM/NOPB Texas Instruments; Manufacturer: Texas Instruments; PartNumber: LM5060MM/NOPB
D8 = SY8303AIC: Description; Copyright: Copyright (C) 2025 Ultra Librarian. All rights reserved.; Manufacturer_Name: Silergy; Manufacturer_Part_Number: SY8303AIC; RefDes: RefDes; Type: Type; ComponentKind: Микросхема; Наименование: SY8303AIC Silergy; Manufacturer: Silergy; PartNumber: SY8303AIC
L2 = L: ComponentKind: Дроссель; Наименование: IHLP2525CZER100M01 Vishay; Manufacturer: Vishay; PartNumber: IHLP2525CZER100M01
R18 = R_1W: as R7 on sheet Лист 1; ComponentKind: Резистор; Type: RC2512; Наименование: RLM25FECR002 TA-I; Manufacturer: TA-I; PartNumber: RLM25FECR002
R19 R20 = R_0,125W: as R2 on sheet Лист 1; ComponentKind: Резистор; Type: RC0805; Наименование: RC0805JR-0710RL Yageo; Manufacturer: Yageo; PartNumber: RC0805JR-0710RL
R21 = R_0,125W: Корпус 0603; Power: 0,125 Вт; Tolerance: 1%; Value: 100 кОм; ComponentKind: Резистор; Type: RC0805; Наименование: RC0805FR-07100KL Yageo; Manufacturer: Yageo; PartNumber: RC0805FR-07100KL
R22 = R_0,125W: Power: 0,125 Вт; Tolerance: 1%; Value: 100 кОм; ComponentKind: Резистор; Type: RC0805; Наименование: RC0805FR-07100KL Yageo; Manufacturer: Yageo; PartNumber: RC0805FR-07100KL
R23 = R_0,5W: Корпус 1206 (1210); Power: 0,5 Вт; Tolerance: 1%; Value: 16,9 кОм; ComponentKind: Резистор; Type: RC1210; Наименование: RC1210FR-0716K9L Yageo; Manufacturer: Yageo; PartNumber: RC1210FR-0716K9L
R24 = R_0,125W: Корпус 0603; Power: 0,125 Вт; Tolerance: 5%; Value: 2 кОм; ComponentKind: Резистор; Type: RC0805; Наименование: RC0805JR-072KL Yageo; Manufacturer: Yageo; PartNumber: RC0805JR-072KL
R25 = R_0,5W: Корпус 1206 (1210); Power: 0,5 Вт; Tolerance: 5%; Value: 10 кОм; ComponentKind: Резистор; Type: RC1210; Наименование: RC1210JR-0710KL Yageo; Manufacturer: Yageo; PartNumber: RC1210JR-0710KL
R26 R29 = R_0,125W: Power: 0,125 Вт; Tolerance: 1%; Value: 15,4 кОм; ComponentKind: Резистор; Type: RC0805; Наименование: RC0805FR-0715K4L Yageo; Manufacturer: Yageo; PartNumber: RC0805FR-0715K4L
R27 = R_0,125W: Power: 0,125 Вт; Tolerance: 1%; Value: 13,3 кОм; ComponentKind: Резистор; Type: RC0805; Наименование: RC0805FR-0713K3L Yageo; Manufacturer: Yageo; PartNumber: RC0805FR-0713K3L
R28 = R_0,125W: Power: 0,125 Вт; Tolerance: 1%; Value: 19,1 кОм; ComponentKind: Резистор; Type: RC0805; Наименование: RC0805FR-0719K1L Yageo; Manufacturer: Yageo; PartNumber: RC0805FR-0719K1L
R30 = R_0,125W: Корпус 0603; Power: 0,125 Вт; Tolerance: 5%; Value: 4,7 кОм; ComponentKind: Резистор; Type: RC0805; Наименование: RC0805JR-074K7L Yageo; Manufacturer: Yageo; PartNumber: RC0805JR-074K7L
R31 = R_0,125W: Power: 0,125 Вт; Tolerance: 5%; Value: 100 кОм; ComponentKind: Резистор; Type: RC0805; Наименование: RC0805JR-07100KL Yageo; Manufacturer: Yageo; PartNumber: RC0805JR-07100KL
R32-R35 = R_0,05W: Power: 0,05 Вт; Tolerance: 5%; Value: 2,2 кОм; ComponentKind: Резистор; Type: RC0201; Наименование: RC0603FR-072K2L Yageo; Manufacturer: Yageo; PartNumber: RC0603FR-072K2L
R36 = R_0,125W: Корпус 0603; Power: 0,125 Вт; Tolerance: 5%; Value: 10 кОм; ComponentKind: Резистор; Type: RC0805; Наименование: RC0805JR-0710KL Yageo; Manufacturer: Yageo; PartNumber: RC0805JR-0710KL
R37 = R_0,05W: Power: 0,05 Вт; Tolerance: 5%; Value: 10 кОм; ComponentKind: Резистор; Type: RC0201; Наименование: RT0603BRD0710KL Yageo; Manufacturer: Yageo; PartNumber: RT0603BRD0710KL
R38 = R_0,125W: Корпус 0603; Power: 0,125 Вт; Tolerance: 1%; Value: 68,1 кОм; ComponentKind: Резистор; Type: RC0805; Наименование: RC0805FR-0768K1L Yageo; Manufacturer: Yageo; PartNumber: RC0805FR-0768K1L
R39 = R_0,125W: as R4 on sheet Лист 1; ComponentKind: Резистор; Type: RC0805; Наименование: RC0805JR-07100KL Yageo; Manufacturer: Yageo; PartNumber: RC0805JR-07100KL
R40 = R_0,125W: Корпус 0603; Power: 0,125 Вт; Tolerance: 1%; Value: 12 кОм; ComponentKind: Резистор; Type: RC0805; Наименование: RC0805FR-0712KL Yageo; Manufacturer: Yageo; PartNumber: RC0805FR-0712KL
R41 = R_0,125W: Power: 0,125 Вт; Tolerance: 1%; Value: 200 кОм; ComponentKind: Резистор; Type: RC0805; Наименование: RC0805FR-07200KL Yageo; Manufacturer: Yageo; PartNumber: RC0805FR-07200KL
VD3 VD4 = VD: 1N4148W; ComponentKind: Диод; Наименование: Диод 1N4148W Diotec Semiconductor; Manufacturer: Diotec Semiconductor; PartNumber: 1N4148W
VD5 = VD: ComponentKind: Диод; Наименование: Диод 1N4148W Diotec Semiconductor; Manufacturer: Diotec Semiconductor; PartNumber: 1N4148W
VT6 VT7 = N_GDS: as VT2 on sheet Лист 1; ComponentKind: Транзистор; Manufacturer: ON Semiconductor; PartNumber: NTMFS5C628NLT1G
VT8 = NPN_BEC: MMBT5551; Наименование: Транзистор MMBT5551LT1G ON Semiconductor; ComponentKind: Транзистор; Manufacturer: ON Semiconductor; PartNumber: MMBT5551LT1G
VT9 = 2N-MOSFET: Наименование: Транзистор BSS138DW-7-F Diodes Inc; ComponentKind: Транзистор; Manufacturer: Diodes Inc; PartNumber: BSS138DW-7-F
X2 = X_14: ComponentKind: Розетка; Наименование: DS1023-2x7 Connfly electronic; Manufacturer: Connfly electronic; PartNumber: DS1023-2x7

## Nets that join several sheets
3V3: Лист 1 (7 pins), Лист 2 (7 pins)
AGND: Лист 1 (49 pins), Лист 2 (22 pins)
ALERT_1: Лист 1 (D1.3), Лист 2 (X2.4)
ALERT_2: Лист 1 (D3.3), Лист 2 (X2.7)
BATT_IN: Лист 1 (FU2.2 VD2.1), Лист 2 (5 pins)
BATT_OUT: Лист 1 (7 pins), Лист 2 (R18.2 R20.2)
DC/DC_IN: Лист 1 (12 pins), Лист 2 (C38.1 C39.1 D8.5 R39.2)
MODE: Лист 1 (D5.7), Лист 2 (X2.5)
NFLT: Лист 1 (D5.11), Лист 2 (X2.9)
SCL_1: Лист 1 (D1.5 D3.5), Лист 2 (D6.5 R32.1 X2.3)
SCL_2: Лист 1 (D5.6), Лист 2 (R34.1 X2.13)
SDA_1: Лист 1 (D1.4 D3.4), Лист 2 (D6.4 R33.1 X2.2)
SDA_2: Лист 1 (D5.5), Лист 2 (R35.1 X2.12)